# Altium schematic sheet Memory.SchDoc
size A4
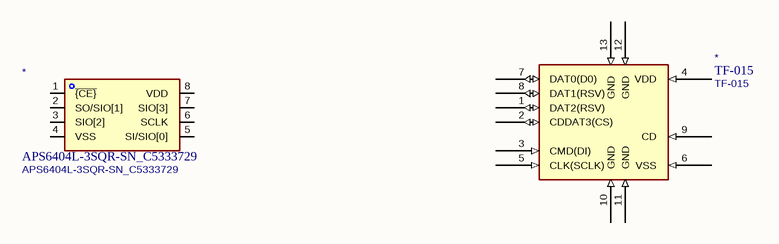
[diagram p0: Memory.SchDoc]

## Parts
(Parts that share a designator on the sheet are numbered #1, #2 ... from top to bottom, then left to right.)
*#1  APS6404L-3SQR-SN_C5333729  [SOIC-8_L4.9-W3.9-P1.27-LS6.0-BL]
*#2  TF-015  [TF-SMD_TF-015]

## Nets

Not connected (* = marked no-connect by the designer): *#1 1(~{{CE}}) 2(SO/SIO[1]) 3(SIO[2]) 4(VSS) 5(SI/SIO[0]) 6(SCLK) 7(SIO[3]) 8(VDD); *#2 1(DAT2(RSV)) 2(CDDAT3(CS)) 3(CMD(DI)) 4(VDD) 5(CLK(SCLK)) 6(VSS) 7(DAT0(D0)) 8(DAT1(RSV)) 9(CD) 10(GND) 11(GND) 12(GND) 13(GND)

## Library data of the parts
*#1 = APS6404L-3SQR-SN_C5333729: Manufacturer: Apmemory; ki_keywords: DRAM; Footprint: easyeda2kicad:SOIC-8_L4.9-W3.9-P1.27-LS6.0-BL; Supplier: https://www.lcsc.com/datasheet/C5333729.pdf; MPN: APS6404L-3SQR-SN; LCSC Part: C5333729; Value: APS6404L-3SQR-SN_C5333729
*#2 = TF-015: Manufacturer: SOFNG(硕方); ki_keywords: SIM Card Connectors; Footprint: easyeda2kicad:TF-SMD_TF-015; Supplier: https://lcsc.com/product-detail/Card-Sockets_TF-015_C113206.html; MPN: TF-015; LCSC Part: C113206; Value: TF-015